# Altium schematic sheet ADC_Frontend.SchDoc: ADC Frontend
size A4; DocumentNumber: 16; SheetNumber: 7; SheetTotal: 16
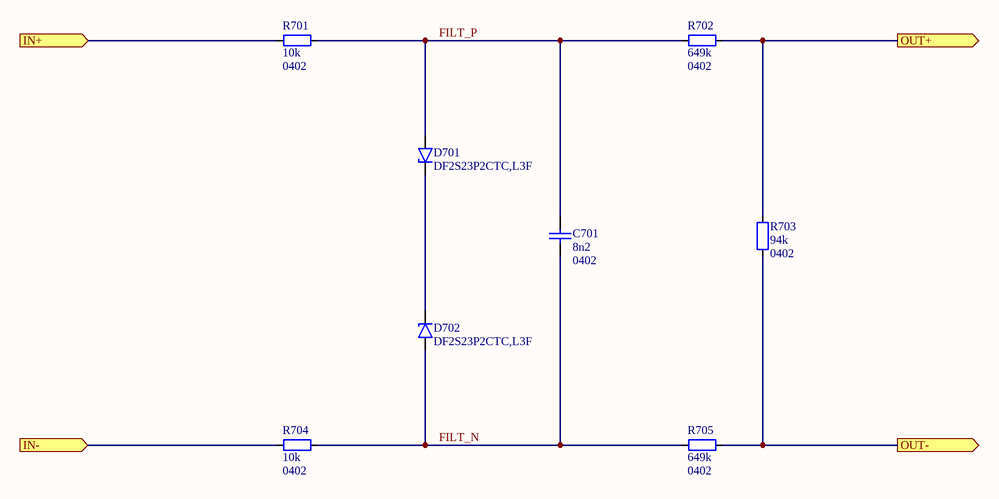
[diagram p0: ADC_Frontend.SchDoc]

## Parts
C701  8n2  Footprint: 0402  [CAP_0402_B]
D701  DF2S23P2CTC,L3F  [DF2S23P2CTC,L3F]
D702  DF2S23P2CTC,L3F  [DF2S23P2CTC,L3F]
R701  10k  Footprint: 0402  [RES_0402_A]
R702  649k  Footprint: 0402  [RES_0402_A]
R703  94k  Footprint: 0402  [RES_0402_A]
R704  10k  Footprint: 0402  [RES_0402_A]
R705  649k  Footprint: 0402  [RES_0402_A]

## Ports
IN+ (in, see ADC[2B]), IN- (in, see ADC[2B]), OUT+ (out, see ADC[2B]), OUT- (out, see ADC[2B])

## Nets
FILT_N: C701.1 D702.1(a) R704.2(a) R705.1(a)
FILT_P: C701.2 D701.1(a) R701.2(a) R702.1(a)
IN+: R701.1(a) ; port IN+
IN-: R704.1(a) ; port IN-
OUT+: R702.2(a) R703.1(a) ; port OUT+
OUT-: R703.2(a) R705.2(a) ; port OUT-
NetD701_2: D701.2 D702.2

## Library data of the parts
C701 = CAP_0402: 0402 SMD Capacitor
D701 D702 = DF2S23P2CTC,L3F: TVS DIODE 21VWM 35.7VC CST2C; Supplier 1: Avnet; Supplier Part Number 1: DF2S23P2CTC,L3F
R701-R705 = RES_0402: 0402 SMD Resistor